# Altium schematic sheet RS485_LoRa_Gateway_1.SchDoc
size A4; SheetNumber: 1; SheetTotal: 3
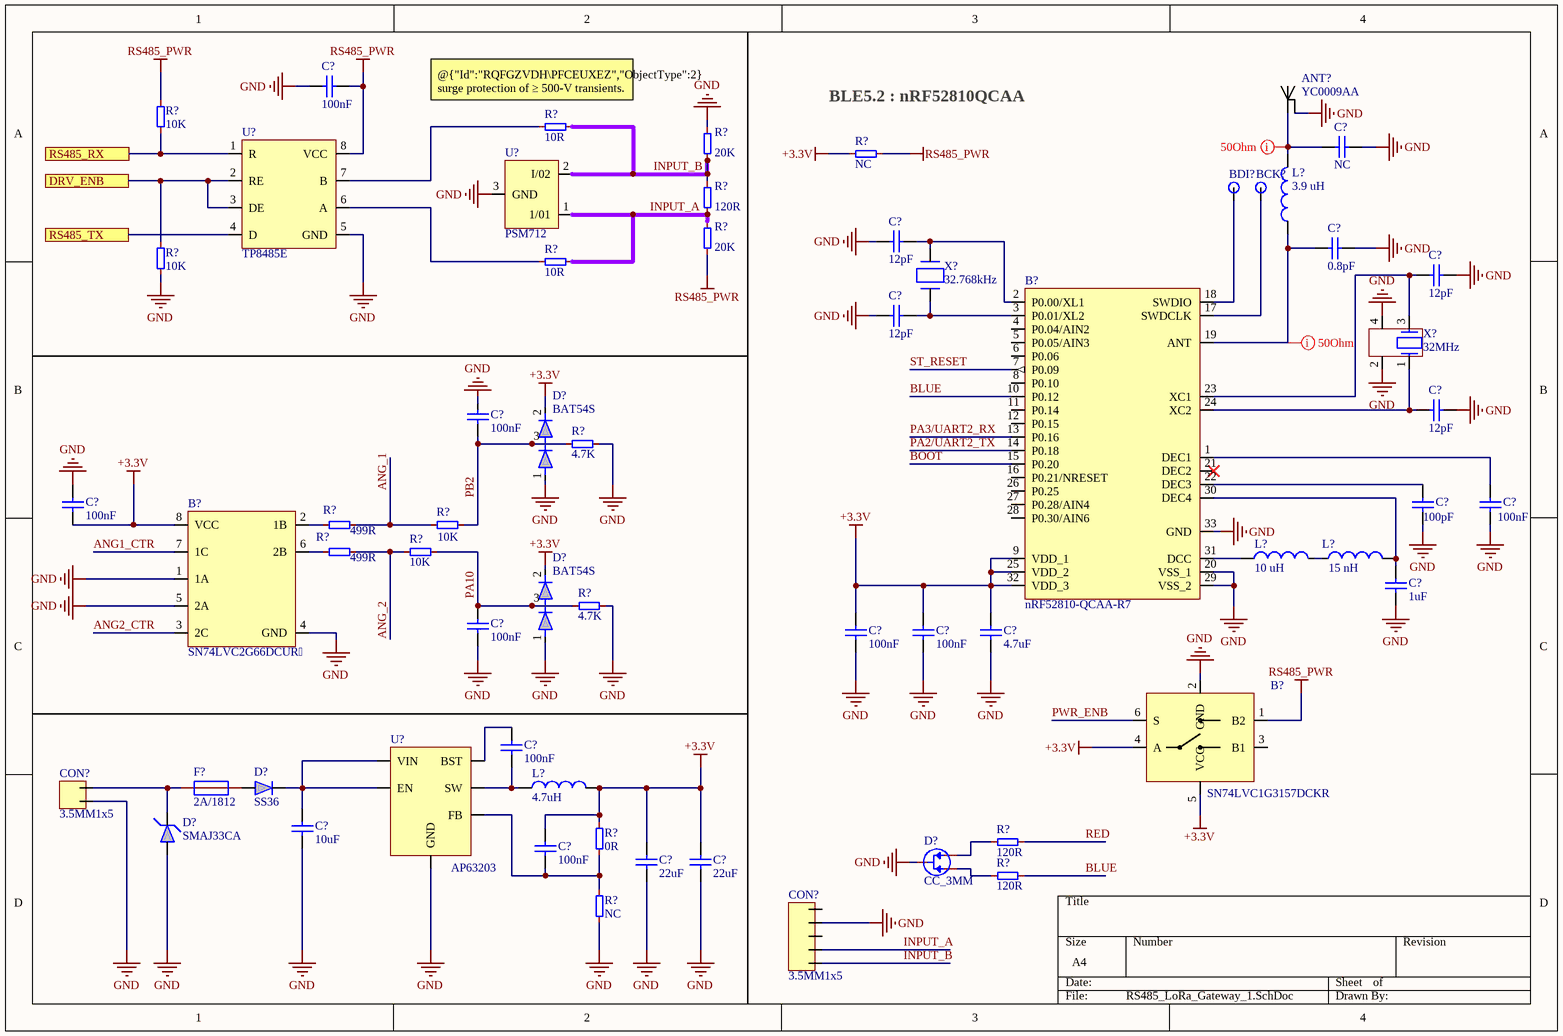
[diagram p0: RS485_LoRa_Gateway_1.SchDoc]

## Parts
(Parts that share a designator on the sheet are numbered #1, #2 ... from top to bottom, then left to right.)
ANT?  YC0009AA  [YC009AA]
B?#1  nRF52810-QCAA-R7  [QFN50P500X500X95-33N]
B?#2  SN74LVC2G66DCUR  [SOP50P310X90-8N]
B?#3  SN74LVC1G3157DCKR  [SOT65P210X110-6N]
BCK?  -  [TH_Pad]  (value not drawn)  (net tie, no BOM)
BDI?  -  [TH_Pad]  (value not drawn)  (net tie, no BOM)
C?#1  100nF  [CAP0402]
C?#2  NC  [CAP0402]  (net tie, no BOM)
C?#3  12pF  [CAP0402]
C?#4  0.8pF  [CAP0402]
C?#5  12pF  [CAP0402]
C?#6  12pF  [CAP0402]
C?#7  100nF  [CAP0402]
C?#8  12pF  [CAP0402]
C?#9  100nF  [CAP0402]
C?#10  100pF  [CAP0402]
C?#11  100nF  [CAP0402]
C?#12  1uF  [CAP0603]
C?#13  100nF  [CAP0402]
C?#14  100nF  [CAP0402]
C?#15  100nF  [CAP0402]
C?#16  4.7uF  [CAP0603]
C?#17  100nF  [CAP0402]
C?#18  10uF  [CAP0805]
C?#19  100nF  [CAP0402]
C?#20  22uF  [CAP0805]
C?#21  22uF  [CAP0805]
CON?#1  3.5MM1x5  [SCREW TERMINAL BLOCK 3.5MM 2X1]
CON?#2  3.5MM1x5  [Terminal_Block_5-P3.5]
D?#1  BAT54S  [SOT23]
D?#2  BAT54S  [SOT23]
D?#3  SS36  [Diode SMD 214AC]
D?#4  SMAJ33CA  [Diode SMD 214AC]
D?#5  CC_3MM  [LED_BiColor_smd]
F?  2A/1812  [FUSC4632X85N]
L?#1  3.9 uH  [IND_0402]
L?#2  value 10 uH  [IND_0603]  (hidden comment: 10uH)
L?#3  value 15 nH  [IND_0402]  (hidden comment: 15nH)
L?#4  4.7uH  [IND_3x3x1.5MM]
R?#1  10K  [RESC0402]
R?#2  10R  [RESC0603]
R?#3  value 20K  [RESC0402]  (hidden comment: NC)
R?#4  NC  [RESC0402]
R?#5  value 120R  [RESC0402]  (hidden comment: NC)
R?#6  value 20K  [RESC0402]  (hidden comment: NC)
R?#7  10K  [RESC0402]
R?#8  10R  [RESC0603]
R?#9  4.7K  [RESC0402]
R?#10  499R  [RESC0805]
R?#11  10K  [RESC0402]
R?#12  499R  [RESC0805]
R?#13  10K  [RESC0402]
R?#14  4.7K  [RESC0402]
R?#15  0R  [RESC0402]
R?#16  120R  [RESC0402]
R?#17  120R  [RESC0402]
R?#18  NC  [RESC0402]
U?#1  TP8485E  [SOIC8]
U?#2  PSM712  [SOT23]
U?#3  AP63203  [SOT23-6]
X?#1  value 32.768kHz  [OSC_3215]  (hidden comment: VALUE)
X?#2  value 32MHz  [OSC_2016]  (hidden comment: OSC_2016)

## Ports
DRV_ENB, RS485_RX (see RS485_LoRa_Gateway_2[1B]), RS485_TX (see RS485_LoRa_Gateway_2[1B])

## Nets
+3.3V: B?#1.9(VDD_1) B?#1.25(VDD_2) B?#1.32(VDD_3) B?#2.8(VCC) B?#3.4(A) B?#3.5(VCC) C?#9.2 C?#14.2 C?#15.2 C?#16.2 C?#19.2 C?#20.2 C?#21.2 D?#1.2 D?#2.2 L?#4.2 R?#4.2 R?#15.1
GND: ANT?.2 B?#1.20(VSS_1) B?#1.29(VSS_2) B?#1.33(GND) B?#2.1(1A) B?#2.4(GND) B?#2.5(2A) B?#3.2(GND) C?#1.1 C?#2.1 C?#3.1 C?#4.1 C?#5.1 C?#6.1 C?#7.2 C?#8.1 C?#9.1 C?#10.2 C?#11.2 C?#12.1 C?#13.1 C?#14.1 C?#15.1 C?#16.1 C?#18.1 C?#20.1 C?#21.1 CON?#1.1 CON?#2.4 D?#1.1 D?#2.1 D?#4.2(A) D?#5.2(C) R?#3.2 R?#7.1 R?#9.1 R?#14.1 R?#18.2 U?#1.5(GND) U?#2.3(GND) U?#3.4(GND) X?#2.2 X?#2.4
RS485_PWR: B?#3.1(B2) C?#1.2 R?#1.2 R?#4.1 R?#6.1 U?#1.8(VCC)
ANG1_CTR: B?#2.7(1C)
ANG2_CTR: B?#2.3(2C)
ANG_1: R?#10.2 R?#11.2
ANG_2: R?#12.2 R?#13.2
BLUE: B?#1.10(P0.12) R?#17.1
BOOT: B?#1.15(P0.20)
DRV_ENB: R?#7.2 U?#1.2(RE) U?#1.3(DE) ; port DRV_ENB
INPUT_A: CON?#2.2 R?#5.1 R?#6.2 R?#8.2 U?#2.1(1/01)
INPUT_B: CON?#2.1 R?#2.2 R?#3.1 R?#5.2 U?#2.2(I/02)
PA2/UART2_TX: B?#1.14(P0.18)
PA3/UART2_RX: B?#1.13(P0.16)
PA10: C?#13.2 D?#2.3 R?#13.1 R?#14.2
PB2: C?#7.1 D?#1.3 R?#9.2 R?#11.1
PWR_ENB: B?#3.6(S)
RED: R?#16.1
RS485_RX: R?#1.1 U?#1.1(R) ; port RS485_RX
RS485_TX: U?#1.4(D) ; port RS485_TX
ST_RESET: B?#1.7(P0.09)
NetANT?_1: ANT?.1 C?#2.2 L?#1.2
NetB?#1_1: B?#1.1(DEC1) C?#11.1
NetB?#1_2: B?#1.2(P0.00/XL1) C?#3.2 X?#1.2(X2)
NetB?#1_3: B?#1.3(P0.01/XL2) C?#6.2 X?#1.1(X1)
NetB?#1_17: B?#1.17(SWDCLK) BCK?.1
NetB?#1_18: B?#1.18(SWDIO) BDI?.1
NetB?#1_19: B?#1.19(ANT) C?#4.2 L?#1.1
NetB?#1_22: B?#1.22(DEC3) C?#10.1
NetB?#1_23: B?#1.23(XC1) C?#5.2 X?#2.3
NetB?#1_24: B?#1.24(XC2) C?#8.2 X?#2.1
NetB?#1_30: B?#1.30(DEC4) C?#12.2 L?#3.2
NetB?#1_31: B?#1.31(DCC) L?#2.1
NetB?#2_2: B?#2.2(1B) R?#10.1
NetB?#2_6: B?#2.6(2B) R?#12.1
NetC?#17_1: C?#17.1 L?#4.1 U?#3.5(SW)
NetC?#17_2: C?#17.2 U?#3.6(BST)
NetC?#18_2: C?#18.2 D?#3.1(K) U?#3.2(EN) U?#3.3(VIN)
NetC?#19_1: C?#19.1 R?#15.2 R?#18.1 U?#3.1(FB)
NetCON?#1_2: CON?#1.2 D?#4.1(K) F?.1
NetD?#3_2: D?#3.2(A) F?.2
NetD?#5_1: D?#5.1(A) R?#16.2
NetD?#5_3: D?#5.3(A) R?#17.2
NetL?#2_2: L?#2.2 L?#3.1
NetR?#2_1: R?#2.1 U?#1.7(B)
NetR?#8_1: R?#8.1 U?#1.6(A)

Not connected (* = marked no-connect by the designer): B?#1 4(P0.04/AIN2) 5(P0.05/AIN3) 6(P0.06) 8(P0.10) 11(P0.14) 12(P0.15) 16(P0.21/NRESET) 21(DEC2)* 26(P0.25) 27(P0.28/AIN4) 28(P0.30/AIN6); B?#3 3(B1); CON?#2 3 5

## Layout directives
net class 50Ohm; rule Width Constraint [Pref Width = 0.254mm    Min Width = 0.254mm    Max Width = 0.254mm]: NetANT?_1, NetB?#1_19

## Notes on the sheet
- (near R?#2) @{"Id":"RQFGZVDH\PFCEUXEZ","ObjectType":2}  surge protection of ≥ 500-V transients.
- (near R?#4) BLE5.2 : nRF52810QCAA

## Library data of the parts
ANT? = YC0009AA: Antennas Embedded, 2400-2500 MHz, Wi-Fi (Bluetooth), Ceramic, -, -, SMD, 3.2 YCA009AA; Manufacturer: Quectel; Manufacturer_Part_Number: YC0009AA
B?#1 = nRF52810-QCAA-R7: NORDIC SEMICONDUCTOR - NRF52810-QCAA-R7 - RF Transceiver, 2.36GHz to 2.5GHz, FSK, 2Mbps, 4dBm out, -89dBm in, 1.7V to 3.6V, QFN-32; Manufacturer: Nordic Semiconductor; Manufacturer_Part_Number: nRF52810-QCAA-R7
B?#2 = SN74LVC2G66DCUR: 2-Channel, 1:1 Analog Switch with Low On-State Resistance; Manufacturer: Texas Instruments; Manufacturer_Part_Number: SN74LVC2G66DCUR
B?#3 = SN74LVC1G: SN74LVC1G3157DCKR, Analogue Switch Single SPDT, 3, 5V, 6-Pin, SC-70; Manufacturer: Texas Instruments; Geometry.Height: 1.1mm; Manufacturer_Part_Number: SN74LVC1G3157DCKR; Arrow Part Number: SN74LVC1G3157DCKR; Arrow Price/Stock: https://www.arrow.com/en/products/sn74lvc1g3157dckr/texas-instruments?region=nac; Datasheet Link: http://www.ti.com/lit/ds/symlink/sn74lvc1g3157.pdf
BCK? BDI? = TH_PAD: Through Hole pad 1mm 0.5mm Hole
C?#1 C?#7 C?#9 C?#11 C?#13-C?#15 C?#17 C?#19 = Capa_0402: Ceramic Capacitor C0G, NP0 0402 100nF 35V; Manufacturer_Part_Number: GRM155R61A104KA01J; Manufacturer: MURATA
C?#2 = Capa_0402
C?#3 C?#5 C?#6 C?#8 = Capa_0402: Multilayer Ceramic Capacitors MLCC - SMD/SMT 50 V 12 pF C0G 0402 5%; Manufacturer_Part_Number: CC0402JRNPO9BN120; Manufacturer: YAGEO
C?#4 = Capa_0402: Ceramic Capacitor C0G, NP0 0402 0.8pF 50V; Manufacturer_Part_Number: CC0402BRNPO9BNR80; Manufacturer: YAGEO
C?#10 = Capa_0402: Ceramic Capacitor C0G, NP0 0402 100nF 50V; Manufacturer_Part_Number: GRM1555C1H101FA01D; Manufacturer: MURATA
C?#12 = Capa_0603: MLCC - SMD/SMT 1 uF 16 VDC 10% 0603 X5R; Manufacturer_Part_Number: GRM188R61C105MA12D; Manufacturer: MURATA
C?#16 = Capa_0603: MLCC - SMD/SMT 4.7 uF 16 VDC 10% 0603 X5R; Manufacturer_Part_Number: CL10A475KQ8NNNC; Manufacturer: Samsung Electro-Mechanics
C?#18 = Capa_0805: MLCC - SMD/SMT 10 uF 50VDC 10% 0805 X6S; Manufacturer_Part_Number: CC0805KKX5R9BB106; Manufacturer: YAGEO
C?#20 = Capa_0805: MLCC - SMD/SMT 22uF 10VDC 20% 0805 X6S; Manufacturer_Part_Number: CC0805KKX7R6BB226; Manufacturer: YAGEO
C?#21 = Capa_0805: MLCC - SMD/SMT 22uF 10VDC 20% 0805 X6S; Manufacturer_Part_Number: CC0805KKX7R6BB226; Manufacturer: MURATA
CON?#1 = Screw Terminal Block 2x1 3.5mm: 3.5mm 1*2 Screw Terminal Block; Manufacturer: XINYA; Package: 1x2x3.5; Manufacturer_Part_Number: *; Supplier: ROBU; Price: *
CON?#2 = Screw Terminal Block 5x1 3.5mm: 3.5mm 1*5 Screw Terminal Block
D?#1 D?#2 = BAT54SWT1G: BAT54S Schottky Diodes & Rectifiers SS SHKY DIO 30V TR; Manufacturer_Part_Number: Nexperia; Manufacturer: BAT54S,235
D?#3 = DIODE: SS36-Slkor-60V 750mV@3A 3A SMA(DO-214AC) Schottky Diodes ROHS\; Manufacturer: Slkor; Manufacturer_Part_Number: SS36; Supplier: Robu; Price: *; Package: DO-214AC
D?#4 = DIODE-ESD: SMAJ36A - 36V 400W ESD Suppressor TVS Diodes 2Pin SMA DO-214AC; Manufacturer: JD; Manufacturer_Part_Number: SMAJ33CA; Supplier: Eveleta; Package: DO-214AC; Price: *
D?#5 = LED_CC: LED Common cathod
F? = Fuse: Resettable Fuse - PTC 24V 01.5A 1812 - SMD1812B150TF/24; Manufacturer: Yageo; Manufacturer_Part_Number: SMD1812B150TF/24; Package: SMD1812; Supplier: *
L?#1 = Inductor: 3.9 nH High frequency chip inductor ±5%  0402; Manufacturer_Part_Number: LQG15HS3N9B02D; Manufacturer: Murata
L?#2 = MCD-01330: 10uH Chip inductor, IDC,min = 50 mA, ±20% 0603; Manufacturer_Part_Number: MLZ1608E100MT; Manufacturer: TDK
L?#3 = MCD-01330: 15 nH High frequency chip inductor ±10% 0402; Manufacturer_Part_Number: LQG15HN15NJ02D; Manufacturer: Murata
L?#4 = INDUCTOR: 1.09A 4.7uH ±3% 163mΩ 3015 Inductors; Manufacturer_Part_Number: SWPA3015S4R7MT; Manufacturer: SUNLORD; Package: 3015; Supplier: Evelta; Price: 6.9
R?#1 R?#7 = RES_0402: Thick Film Resistors - SMD 1/16watt 10Kohms 0402 1% Commercial Use; Manufacturer_Part_Number: CRCW040210K0FKEDC; Manufacturer: Vishay; Parameter 1: *
R?#2 R?#8 = RES_0603: Thick Film Resistors - SMD 1/10Watt 10ohms 1% Commercial Use; Manufacturer_Part_Number: CRCW060310R0FKEBC; Manufacturer: Vishay; Parameter 1: *
R?#3 R?#5 R?#6 = RES_0402: Resistor SMD 0402; Manufacturer_Part_Number: *; Manufacturer: *
R?#4 = RES_0402: Thick Film Resistors - SMD 1/16watt 0R 1% 0402 Commercial Use; Manufacturer_Part_Number: RC0402FR-070RL; Manufacturer: YAGEO; Parameter 1: *
R?#9 R?#14 = RES_0402: Thin Film Resistors - SMD 4.7Kohms 0.1% 0402 25ppm; Manufacturer_Part_Number: RT0402BRD074K7L; Manufacturer: YAGEO; Parameter 1: *
R?#10 R?#12 = RES_0805: Thin Film Resistors - SMD 499ohms 0.1% 25ppm; Manufacturer_Part_Number: TNPW0805499RBEEA; Manufacturer: Vishay; Parameter 1: *
R?#11 R?#13 R?#18 = RES_0402: Thick Film Resistors - SMD 1/16watt 10Kohms 0.1% 0402 Commercial Use; Manufacturer_Part_Number: MCS04020D1002BE000; Manufacturer: Vishay; Parameter 1: *
R?#15 = RES_0402: Thick Film Resistors - SMD 1/16watt 0R 1% 0402 Commercial Use; Manufacturer_Part_Number: RC0402FR-070RL; Manufacturer: Vishay; Parameter 1: *
R?#16 = RES_0402: Thin Film Resistors - SMD 120Kohms 1% 0402 25ppm; Manufacturer_Part_Number: RT0402FRE07120RL; Manufacturer: YAGEO; Parameter 1: *
R?#17 = RES_0402: Thin Film Resistors - SMD 120Rs 1% 0402 25ppm; Manufacturer_Part_Number: RT0402FRE07120RL; Manufacturer: YAGEO; Parameter 1: *
U?#1 = TP8485E: TP8485E RS485 Tranreciver 3V-5.5V SOIC8; Manufacturer: 3PEAK; Manufacturer_Part_Number: TP8485
U?#2 = PSM712: Asymmerical TVS Diode for Extended Common-Mode RS-485; Manufacturer_Part_Number: SM712H-TP-B002; Manufacturer: Micro Commercial Components (MCC)
U?#3 = AP63205: AP63205 - Switching Voltage Regulators 5V OUT DCDC 3.8V-32V Conv HV Buck TSOT26 T&R 3K; Manufacturer_Part_Number: AP63203QWU-7; Manufacturer: Diodes Incorporated; Price: *
X?#1 = OSC_2012: Crystal Osc 2012; Manufacturer_Part_Number: ECS-.327-12.5-34B-TR; Manufacturer: ECS
X?#2 = OSC_2016: Crystal Osc 2016 32MHz; Manufacturer_Part_Number: XRCGB32M000F2P01R0; Manufacturer: Murata